# EasyEDA Pro project C8T6v1.eprj, board PCB4
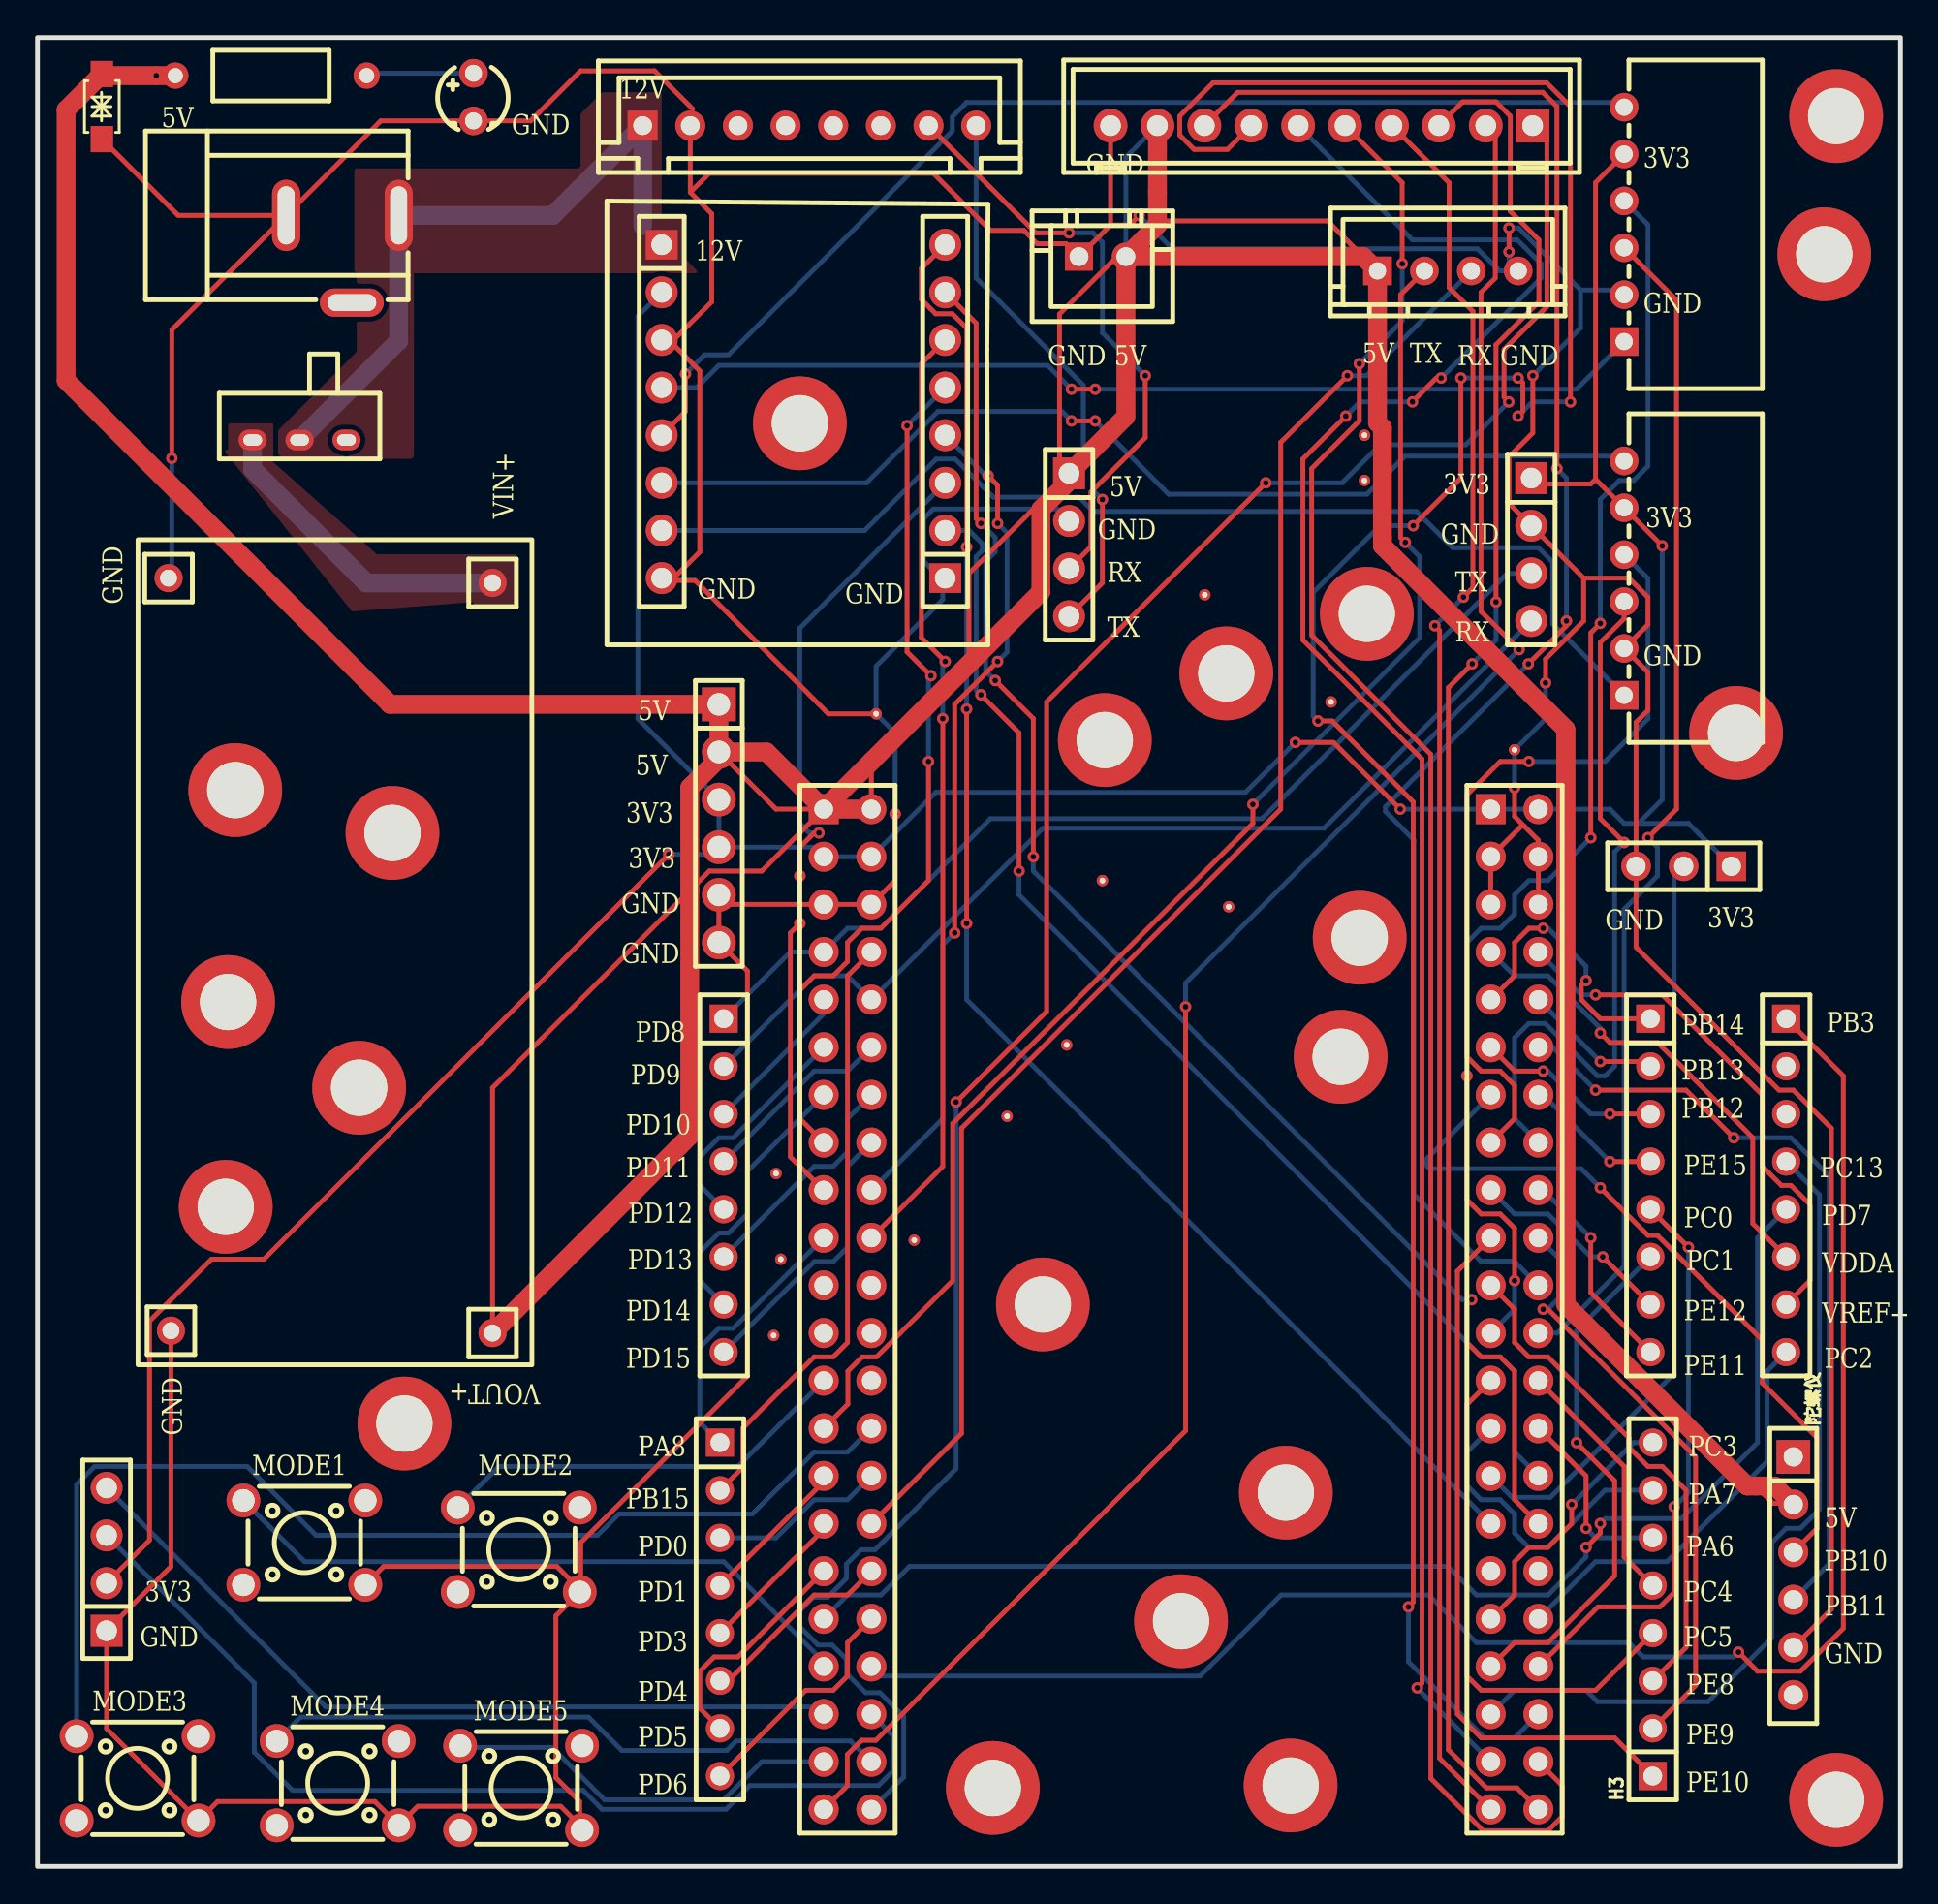
[diagram p8: board, top side]
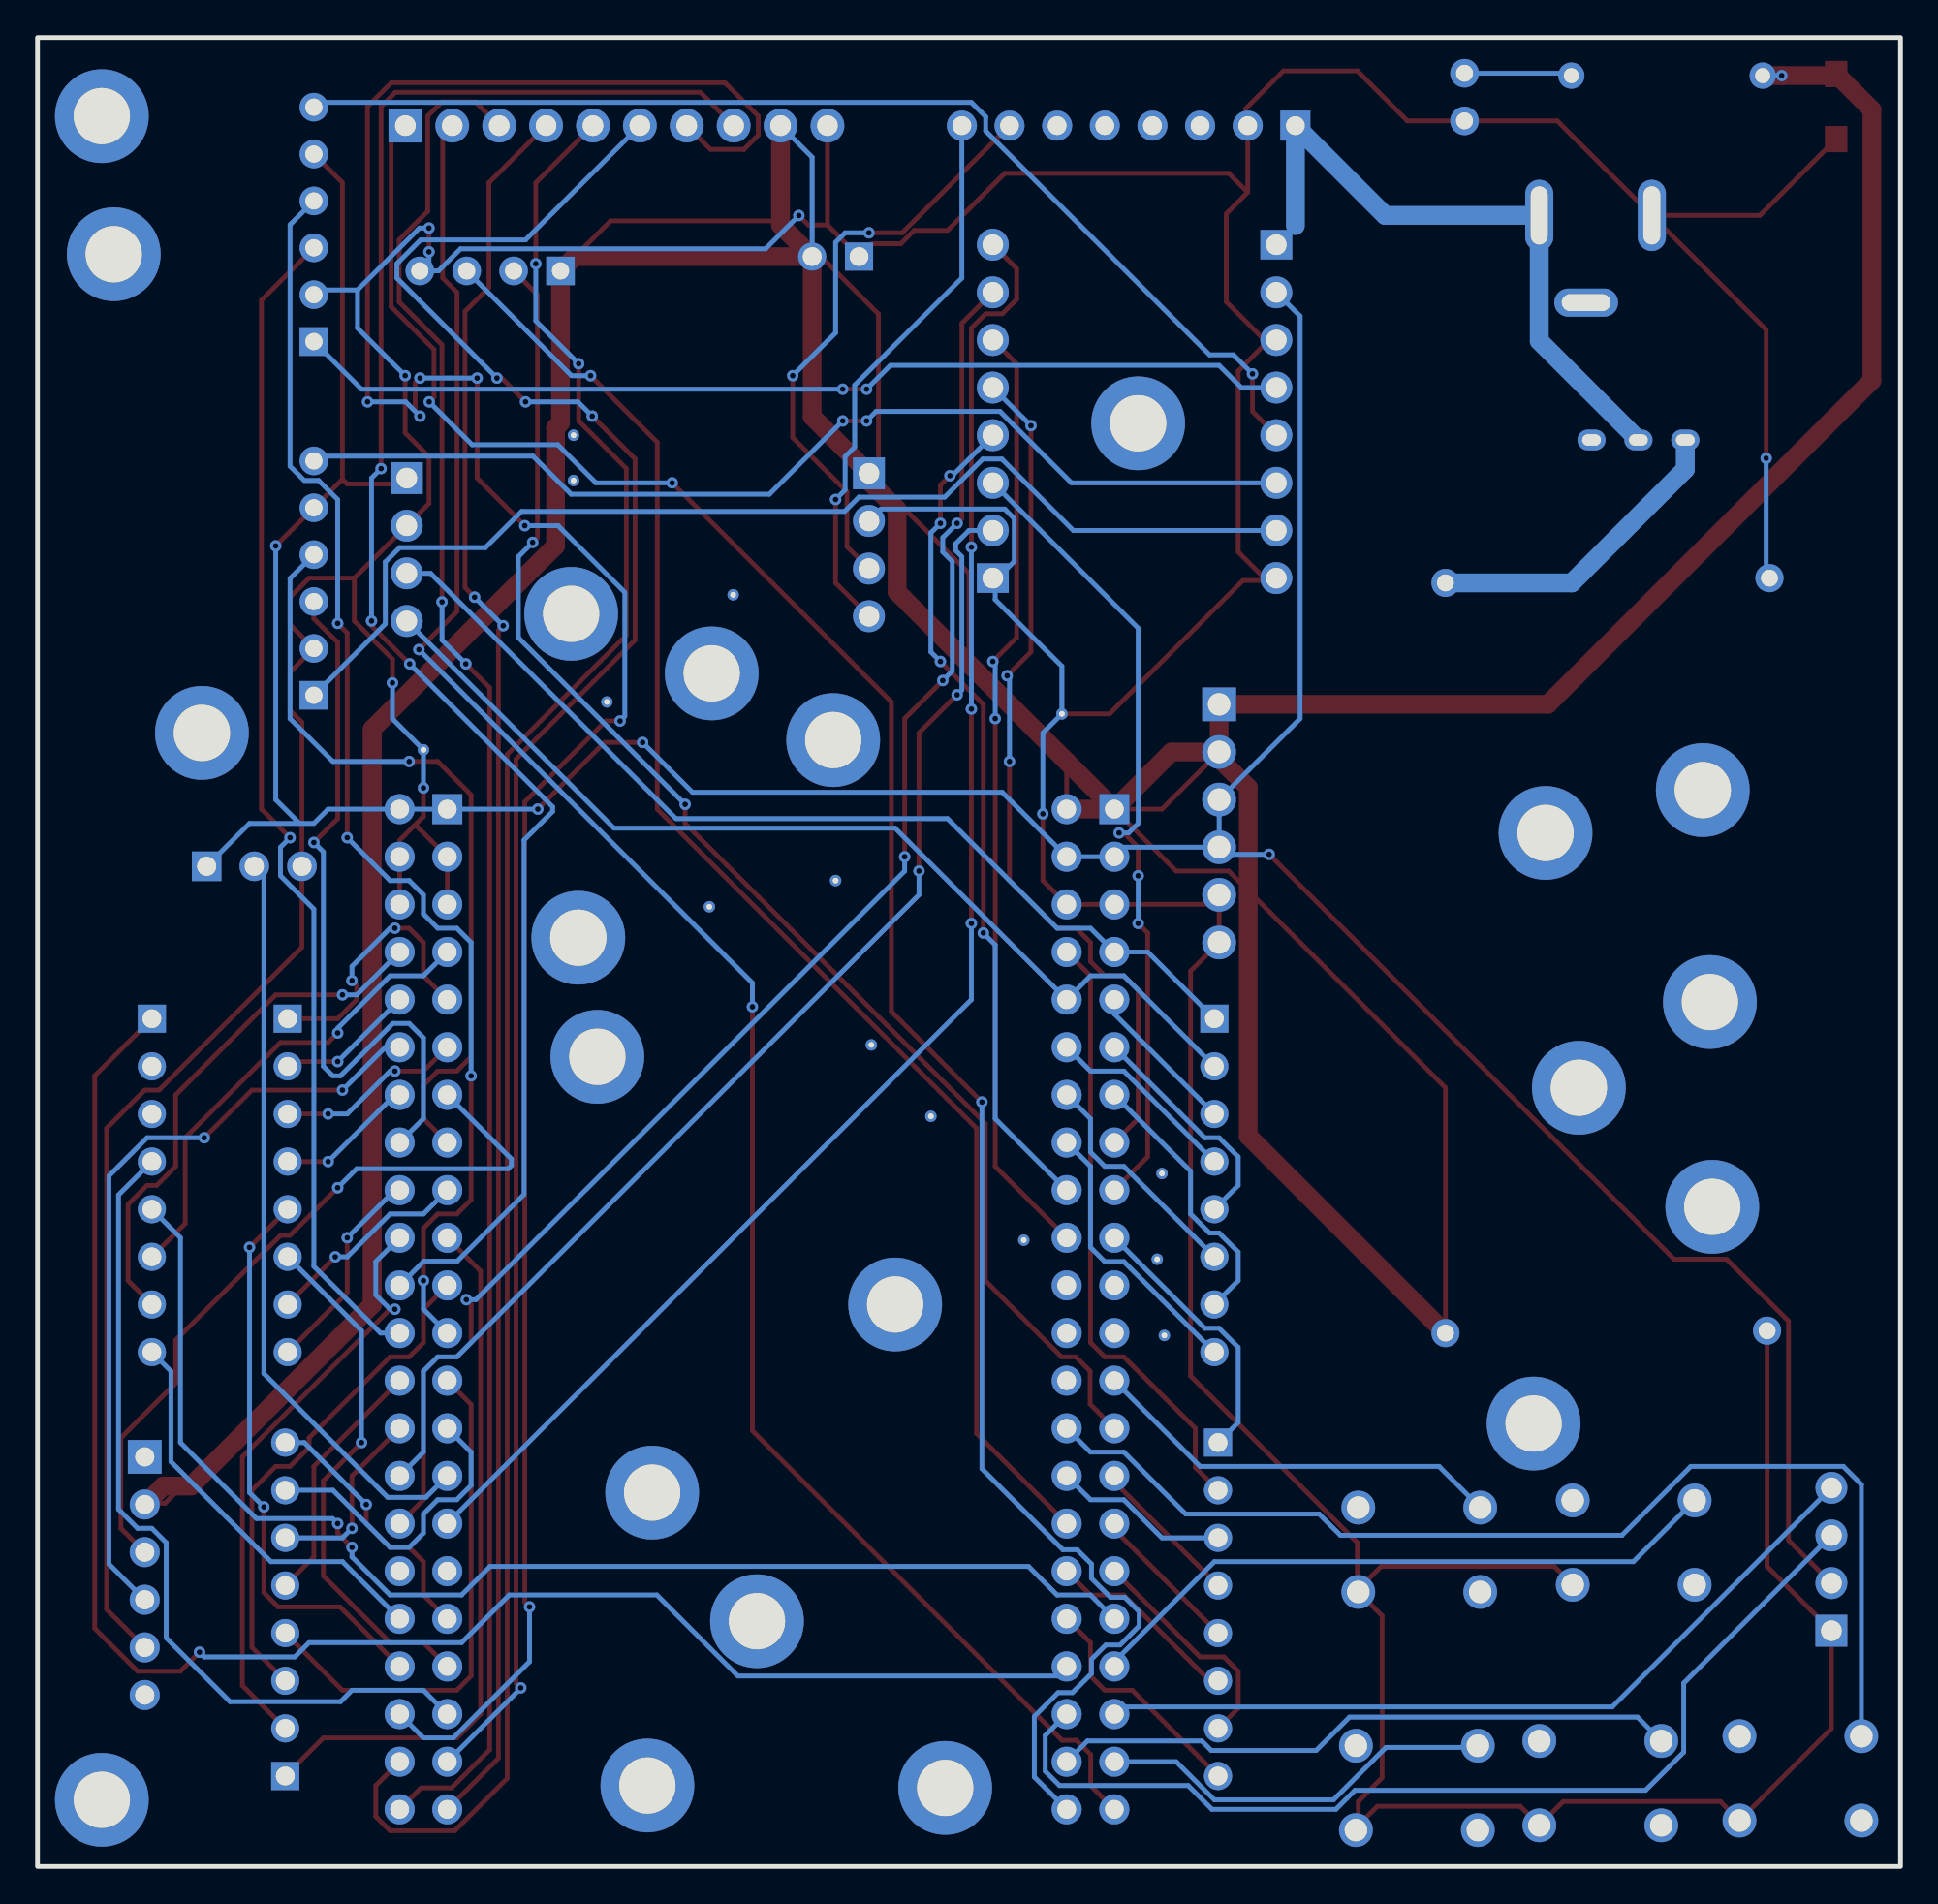
[diagram p9: board, bottom side, seen from below]

Outline 99.31 x 97.54 mm; copper layers: Top Layer, Bottom Layer. Coordinates in mm from the lower left corner of the outline.
Outline path: rectangle 0,97.54 99.31,0
Stack: Top Layer 0.035mm / Dielectric1 1.51mm FR4 er 4.5 / Bottom Layer 0.035mm

## Design rules (mm)
template: 自定义配置
spacing copperThickness1oz (default): track to track 0.102, other pairs 0.152 to 0.3
spacing copperThickness2oz: track to track 0.203, other pairs 0.152 to 0.3
track width copperThickness1oz (default): min 0.127, default 0.254, max 2.54
track width copperThickness2oz: min 0.203, default 0.254, max 2.54
differential pair differentialPair (default): width min 0.127, default 0.254, max 2.54; gap min 0.152, default 0.152
via viaSize (default): diameter min 0.5, default 0.61, max 10; hole min 0.3, default 0.305, max 6.3

## Placement (name value [footprint] x y rotation side)
CN2  HX-XH2.54-2PZZ  [CONN-TH_2P-P2.50_HX-2.54MM-2P-ZZ-MS]  56.77 85.85 0 top
CN4  A254F2L1-2W8P11  [CONN-TH_8P-P2.54_A254F2L1-2W8P11]  41.15 92.84 0 top
D1  SMF6.0CA  [SOD-123FL_L2.7-W1.8-LS3.8-BI]  3.43 93.85 270 top
DC1  DC-005-A200  [DC-IN-TH_DC-005-A200]  16.26 85.72 0 top
H1  PM254V-11-04-H85  [HDR-TH_4P-P2.54-V-F]  3.68 16.38 90 top
H2  PM254V-11-03-H85  [HDR-TH_3P-P2.54-V-F]  87.76 53.34 180 top
H3  PZ254V-11-08P  [HDR-TH_8P-P2.54-V-M]  86.11 13.72 90 top
H4  PZ254V-11-08P  [HDR-TH_8P-P2.54-V-M]  85.98 36.32 270 top
H5  PZ254V-11-08P  [HDR-TH_8P-P2.54-V-M]  93.22 36.32 270 top
H7  PZ254V-11-08P  [HDR-TH_8P-P2.54-V-M]  36.58 36.32 270 top
H8  PZ254V-11-08P  [HDR-TH_8P-P2.54-V-M]  36.38 13.72 270 top
H9  2.54-1x6P直针  [HDR-TH_6P-P2.54-V-M-1]  36.32 55.63 270 top
H10  PZ254V-11-04P  [HDR-TH_4P-P2.54-V-M]  54.99 70.48 270 top
H12  PZ254V-11-04P  [HDR-TH_4P-P2.54-V-M]  79.63 70.23 270 top
K230  WAFER-XH254Z-4AM  [CONN-TH_WAFER-XH2.54-4PZZ-H62]  75.18 85.09 0 top
LED1  RAD0.3  [LED-TH_BD3.8-P2.54-RD]  23.24 94.36 90 top
NOREF  -  [Pad_e6789]  95.88 3.56 0 top
NOREF#2  -  [Pad_e6791]  66.55 19.94 0 top
NOREF#3  -  [Pad_e8003]  68.96 62.1 0 top
NOREF#4  -  [Pad_e6798]  95.25 85.98 0 top
NOREF#5  -  [Pad_e8001]  39.62 32.38 0 top
NOREF#6  -  [Pad_e6800]  10.03 35.18 0 top
NOREF#7  -  [Pad_e6801]  19.56 23.62 0 top
NOREF#8  -  [Pad_e7414]  56.77 52.58 0 top
NOREF#9  -  [Pad_e8000]  39.24 28.32 0 top
NOREF#10  -  [Pad_e6805]  40.64 76.96 0 top
NOREF#11  -  [Pad_e8005]  70.74 76.33 0 top
NOREF#12  -  [Pad_e8586]  78.74 59.55 0 top
NOREF#13  -  [Pad_e6790]  60.96 13.08 0 top
NOREF#14  -  [Pad_e6788]  50.93 4.19 0 top
NOREF#15  -  [Pad_e6785]  17.14 41.53 0 top
NOREF#16  -  [Pad_e6792]  53.59 29.97 0 top
NOREF#17  -  [Pad_e6797]  95.88 93.34 0 top
NOREF#18  -  [Pad_e6781]  69.47 43.18 0 top
NOREF#19  -  [Pad_e7418]  51.69 40 0 top
NOREF#20  -  [Pad_e8002]  62.23 67.82 0 top
NOREF#21  -  [Pad_e7417]  54.86 43.81 0 top
NOREF#22  -  [Pad_e6786]  18.92 55.12 0 top
NOREF#23  -  [Pad_e6793]  70.87 66.8 0 top
NOREF#24  -  [Pad_e8006]  44.7 61.47 0 top
NOREF#25  -  [Pad_e7999]  39.37 36.96 0 top
NOREF#26  -  [Pad_e6784]  10.16 46.1 0 top
NOREF#27  -  [Pad_e8004]  70.74 73.91 0 top
NOREF#28  -  [Pad_e6794]  63.37 63.63 0 top
NOREF#29  -  [Pad_e6796]  56.9 60.07 0 top
NOREF#30  -  [Pad_e6804]  66.8 4.32 0 top
NOREF#31  -  [Pad_e6802]  90.55 60.45 0 top
NOREF#32  -  [Pad_e7998]  46.74 33.4 0 top
NOREF#33  -  [Pad_e6803]  70.48 49.53 0 top
NOREF#34  -  [Pad_e7416]  63.5 51.18 0 top
NOREF#35  -  [Pad_e6783]  10.54 57.4 0 top
R2  1kΩ  [RES-TH_BD2.7-L6.2-P10.20-D0.4]  12.45 95.5 180 top
SW1  MK-12D18-G020  [SW-TH_MK-12D18-G040]  13.97 76.07 180 top
SW2  TS665CJ  [SW-TH_4P-L6.0-W6.0-P4.50-LS6.5]  14.22 17.27 0 top
SW3  TS665CJ  [SW-TH_4P-L6.0-W6.0-P4.50-LS6.5]  25.65 16.89 0 top
SW4  TS665CJ  [SW-TH_4P-L6.0-W6.0-P4.50-LS6.5]  5.33 4.7 0 top
SW5  TS665CJ  [SW-TH_4P-L6.0-W6.0-P4.50-LS6.5]  16 4.44 0 top
SW6  TS665CJ  [SW-TH_4P-L6.0-W6.0-P4.50-LS6.5]  25.78 4.19 0 top
U1  HC-PM254-8.5H-2x22PZ  [HDR-TH_44P-P2.54-V-F-R2-C22-S2.54]  43.18 29.72 270 top
U2  HC-PM254-8.5H-2x22PZ  [HDR-TH_44P-P2.54-V-F-R2-C22-S2.54]  78.74 29.72 270 top
U5  WAFER-XH254WZ-6A  [CONN-TH_6P-P2.50_WAFER-XH254WZ-6A]  84.58 87.57 90 top
U6  WAFER-XH254WZ-6A  [CONN-TH_6P-P2.50_WAFER-XH254WZ-6A]  84.58 68.71 90 top
U7  PM254-1-08-Z-8.5  [HDR-TH_8P-P2.54-V-F]  33.27 77.6 270 top
U8  PM254-1-08-Z-8.5  [HDR-TH_8P-P2.54-V-F]  48.39 77.6 90 top
U19  MTBD1-D011000  [CONN-TH_MTBD1-D011000]  24.26 68.45 180 top
U20  MTBD1-D011000  [CONN-TH_MTBD1-D011000]  6.98 68.71 180 top
U21  MTBD1-D011000  [CONN-TH_MTBD1-D011000]  7.11 28.57 180 top
U22  MTBD1-D011000  [CONN-TH_MTBD1-D011000]  24.26 28.45 180 top
循迹  ZX-XH2.54-10PZZ  [CONN-TH_10P-P2.50_B10B-XH-A-LF-SN]  68.45 92.84 180 top
陀螺仪  2.54-1*6P母  [HDR-TH_6P-P2.54-V-F]  93.6 15.49 270 top

## Footprints (pads in the part's own frame, mm; a bottom-side part is the same pattern mirrored in y, then rotated)
CONN-TH_2P-P2.50_HX-2.54MM-2P-ZZ-MS
  rect 1.5x1.5 hole 1: 1(-1.25,0)
  round 1.5 hole 1: 2(1.25,0)
CONN-TH_6P-P2.50_WAFER-XH254WZ-6A
  rect 1.524x1.524 hole 0.914: 1(-6.25,0)
  round 1.524 hole 0.914: 2(-3.75,0) 3(-1.25,0) 4(1.25,0) 5(3.75,0) 6(6.25,0)
CONN-TH_8P-P2.54_A254F2L1-2W8P11
  rect 1.6x1.6 hole 1: 1(-8.89,0)
  round 1.6 hole 1: 2(-6.35,0) 3(-3.81,0) 4(-1.27,0) 5(1.27,0) 6(3.81,0) 7(6.35,0) 8(8.89,0)
CONN-TH_10P-P2.50_B10B-XH-A-LF-SN
  rect 1.8x1.8 hole 1.1: 1(-11.25,-0.001)
  round 1.8 hole 1.1: 2(-8.752,0.001) 3(-6.25,-0.001) 4(-3.75,-0.001) 5(-1.25,-0.001) 6(1.25,-0.001) 7(3.75,-0.001) 8(6.25,0.001) 9(8.75,0) 10(11.25,0)
CONN-TH_MTBD1-D011000
  round 1.5 hole 0.9: 1(0,0)
CONN-TH_WAFER-XH2.54-4PZZ-H62
  rect 1.524x1.524 hole 0.914: 1(-3.75,0)
  round 1.524 hole 0.914: 2(-1.25,0) 3(1.25,0) 4(3.75,0)
DC-IN-TH_DC-005-A200
  oval 1.5x3.8 hole 0.9x3.1: 1(3,2.325) 2(-3,2.325)
  oval 3.4x1.5 hole 2.6x0.9: 3(0.5,-2.325)
HDR-TH_3P-P2.54-V-F
  rect 1.575x1.575 hole 1.02: 1(-2.54,0)
  round 1.575 hole 1.02: 2(0,0) 3(2.54,0)
HDR-TH_4P-P2.54-V-F
  rect 1.7x1.7 hole 1.1: 1(-3.81,0)
  round 1.7 hole 1.1: 2(-1.27,0) 3(1.27,0) 4(3.81,0)
HDR-TH_4P-P2.54-V-M
  rect 1.7x1.7 hole 1.1: 1(-3.81,0)
  round 1.7 hole 1.1: 2(-1.27,0) 3(1.27,0) 4(3.81,0)
HDR-TH_6P-P2.54-V-F
  rect 1.8x1.8 hole 1.02: 1(-6.35,0)
  round 1.6 hole 1.02: 2(-3.81,0) 3(-1.27,0) 4(1.27,0) 5(3.81,0) 6(6.35,0)
HDR-TH_6P-P2.54-V-M-1
  rect 1.8x1.8 hole 1.2: 1(-6.35,0)
  round 1.8 hole 1.2: 2(-3.81,0) 3(-1.27,0) 4(1.27,0) 5(3.81,0) 6(6.35,0)
HDR-TH_8P-P2.54-V-F
  rect 1.575x1.7 hole 1.1: 1(-8.89,0)
  round 1.7 hole 1.1: 2(-6.35,0) 3(-3.81,0) 4(-1.27,0) 5(1.27,0) 6(3.81,0) 7(6.35,0) 8(8.89,0)
HDR-TH_8P-P2.54-V-M
  rect 1.5x1.5 hole 1: 1(-8.89,0)
  round 1.5 hole 1: 2(-6.35,0) 3(-3.81,0) 4(-1.27,0) 5(1.27,0) 6(3.81,0) 7(6.35,0) 8(8.89,0)
HDR-TH_44P-P2.54-V-F-R2-C22-S2.54
  rect 1.6x1.6 hole 1: 1(-26.67,-1.27)
  round 1.6 hole 1: 2(-26.67,1.27) 3(-24.13,-1.27) 4(-24.13,1.27) 5(-21.59,-1.27) 6(-21.59,1.27) 7(-19.05,-1.27) 8(-19.05,1.27) 9(-16.51,-1.27) 10(-16.51,1.27) 11(-13.97,-1.27) 12(-13.97,1.27) 13(-11.43,-1.27) 14(-11.43,1.27) 15(-8.89,-1.27) 16(-8.89,1.27) 17(-6.35,-1.27) 18(-6.35,1.27) 19(-3.81,-1.27) 20(-3.81,1.27) 21(-1.27,-1.27) 22(-1.27,1.27) 23(1.27,-1.27) 24(1.27,1.27) 25(3.81,-1.27) 26(3.81,1.27) 27(6.35,-1.27) 28(6.35,1.27) 29(8.89,-1.27) 30(8.89,1.27) 31(11.43,-1.27) 32(11.43,1.27) 33(13.97,-1.27) 34(13.97,1.27) 35(16.51,-1.27) 36(16.51,1.27) 37(19.05,-1.27) 38(19.05,1.27) 39(21.59,-1.27) 40(21.59,1.27) 41(24.13,-1.27) 42(24.13,1.27) 43(26.67,-1.27) 44(26.67,1.27)
LED-TH_BD3.8-P2.54-RD
  round 1.524 hole 0.9: 1(-1.27,0) 2(1.27,0)
Pad_e6781
  round 5 hole 3: 1(0,0)
Pad_e6783
  round 5 hole 3: 1(0,0)
Pad_e6784
  round 5 hole 3: 1(0,0)
Pad_e6785
  round 5 hole 3: 1(0,0)
Pad_e6786
  round 5 hole 3: 1(0,0)
Pad_e6788
  round 5 hole 3: 1(0,0)
Pad_e6789
  round 5 hole 3: 1(0,0)
Pad_e6790
  round 5 hole 3: 1(0,0)
Pad_e6791
  round 5 hole 3: 1(0,0)
Pad_e6792
  round 5 hole 3: 1(0,0)
Pad_e6793
  round 5 hole 3: 1(0,0)
Pad_e6794
  round 5 hole 3: 1(0,0)
Pad_e6796
  round 5 hole 3: 1(0,0)
Pad_e6797
  round 5 hole 3: 1(0,0)
Pad_e6798
  round 5 hole 3: 1(0,0)
Pad_e6800
  round 5 hole 3: 1(0,0)
Pad_e6801
  round 5 hole 3: 1(0,0)
Pad_e6802
  round 5 hole 3: 1(0,0)
Pad_e6803
  round 5 hole 3: 1(0,0)
Pad_e6804
  round 5 hole 3: 1(0,0)
Pad_e6805
  round 5 hole 3: 1(0,0)
Pad_e7414
  round 0.61 hole 0.305: 1(0,0)
Pad_e7416
  round 0.61 hole 0.305: 1(0,0)
Pad_e7417
  round 0.61 hole 0.305: 1(0,0)
Pad_e7418
  round 0.61 hole 0.305: 1(0,0)
Pad_e7998
  round 0.61 hole 0.305: 1(0,0)
Pad_e7999
  round 0.61 hole 0.305: 1(0,0)
Pad_e8000
  round 0.61 hole 0.305: 1(0,0)
Pad_e8001
  round 0.61 hole 0.305: 1(0,0)
Pad_e8002
  round 0.61 hole 0.305: 1(0,0)
Pad_e8003
  round 0.61 hole 0.305: 1(0,0)
Pad_e8004
  round 0.61 hole 0.305: 1(0,0)
Pad_e8005
  round 0.61 hole 0.305: 1(0,0)
Pad_e8006
  round 0.61 hole 0.305: 1(0,0)
Pad_e8586
  round 0.61 hole 0.305: 1(0,0)
RES-TH_BD2.7-L6.2-P10.20-D0.4
  round 1.4 hole 0.8: 1(-5.1,0) 2(5.1,0)
SOD-123FL_L2.7-W1.8-LS3.8-BI
  rect 1.4x1.2 smd: 1(-1.735,0) 2(1.735,0)
SW-TH_4P-L6.0-W6.0-P4.50-LS6.5
  round 1.8 hole 1.2: 1(-3.25,2.25) 2(3.25,2.25) 3(-3.25,-2.25) 4(3.25,-2.25)
SW-TH_MK-12D18-G040
  oval 1.5x1.1 hole 1x0.6: 1(-2.5,0) 2(0,0) 3(2.5,0)

## Nets
3V3: H1.2 H2.1 H9.3 H9.4 H12.1 U1.3 U1.4 U2.1 U2.2 U5.5 U6.5 U7.2
5V: CN2.2 D1.1 H9.1 H9.2 H10.1 K230.1 R2.2 U1.1 U1.2 U22.1 循迹.9 陀螺仪.2
12V: CN4.1 DC1.1 SW1.2 U7.1
GND: CN2.1 CN4.2 D1.2 DC1.2 H1.1 H2.3 H9.5 H9.6 H10.2 H12.2 K230.4 LED1.1 NOREF#12.1 NOREF#24.1 SW2.4 SW3.4 SW4.4 SW5.4 SW6.4 U1.5 U1.6 U2.3 U2.4 U2.5 U2.6 U5.2 U6.2 U7.3 U7.8 U8.1 U20.1 U21.1 循迹.10 陀螺仪.5
VDDA: H5.6 U2.7
AIN1: U1.20 U8.6
AIN2: U2.32 U8.7
AO1: U5.1 U7.4
AO2: U5.6 U7.5
BIN1: U1.18 U8.4
BIN2: U1.17 U8.3
BO1: U6.1 U7.7
BO2: U6.6 U7.6
ENCA_L: U2.23 U5.4
ENCA_R: U2.15 U6.4
ENCB_L: U2.24 U5.3
ENCB_R: U2.16 U6.3
O_SCL: H1.3 U1.40
O_SDA: H1.4 U1.39
PA3: U2.31 U8.8
PA4: U2.30 U8.2
PA5: H2.2 U2.29
PA6: H3.6 U2.28
PA7: H3.7 U2.27
PA8: H8.1 U1.19
PB3: H5.1 U1.38
PB5: SW2.1 U1.37
PB8: SW5.1 U1.42
PB9: SW6.1 U1.41
PB10: U2.13 陀螺仪.3
PB11: U2.12 陀螺仪.4
PB12: H4.3 U2.11
PB13: H4.2 U2.10
PB14: H4.1 U2.9
PB15: H8.2 U1.8
PC0: H4.5 U2.38
PC1: H4.6 U2.37
PC2: H5.8 U2.36
PC3: H3.8 U2.35
PC4: H3.5 U2.26
PC5: H3.4 U2.25
PC6: U1.15 U8.5
PC10: SW3.1 U1.25
PC11: SW4.1 U1.28
PC12: K230.2 U1.27
PC13: H5.4 U2.39
PD0: H8.3 U1.30
PD1: H8.4 U1.29
PD2: K230.3 U1.32
PD3: H8.5 U1.31
PD4: H8.6 U1.34
PD5: H8.7 U1.33
PD6: H8.8 U1.36
PD7: H5.5 U1.35
PD8: H7.1 H12.3 U1.7
PD9: H7.2 H12.4 U1.10
PD10: H7.3 U1.9
PD11: H7.4 U1.12
PD12: H7.5 U1.11
PD13: H7.6 U1.14
PD14: H7.7 U1.13
PD15: H7.8 U1.16
PE0: U1.44 循迹.1
PE1: U1.43 循迹.2
PE2: U2.44 循迹.3
PE3: U2.43 循迹.4
PE4: U2.42 循迹.5
PE5: U2.41 循迹.6
PE6: U2.40 循迹.7
PE7: U2.22 循迹.8
PE8: H3.3 U2.21
PE9: H3.2 U2.20
PE10: H3.1 U2.19
PE11: H4.8 U2.18
PE12: H4.7 U2.17
PE15: H4.4 U2.14
POWER: SW1.3 U19.1
R/A/H: CN4.7 H10.3
T/B/L: CN4.8 H10.4
VREF+: H5.7 U2.8
$1N1923: LED1.2 R2.1

Pads without a net: CN4 3 4 5 6; DC1 3; H5 2 3; NOREF 1; NOREF#2 1; NOREF#3 1; NOREF#4 1; NOREF#5 1; NOREF#6 1; NOREF#7 1; NOREF#8 1; NOREF#9 1; NOREF#10 1; NOREF#11 1; NOREF#13 1; NOREF#14 1; NOREF#15 1; NOREF#16 1; NOREF#17 1; NOREF#18 1; NOREF#19 1; NOREF#20 1; NOREF#21 1; NOREF#22 1; NOREF#23 1; NOREF#25 1; NOREF#26 1; NOREF#27 1; NOREF#28 1; NOREF#29 1; NOREF#30 1; NOREF#31 1; NOREF#32 1; NOREF#33 1; NOREF#34 1; NOREF#35 1; SW1 1; SW2 2 3; SW3 2 3; SW4 2 3; SW5 2 3; SW6 2 3; U1 21 22 23 24 26; U2 33 34; 陀螺仪 1 6

## Via types
v1: diameter 0.61, hole 0.305, Top Layer to Bottom Layer, 99 vias

## Routing (per net, layer and track width the routed paths; a pad name or vN(x,y) marks a point on that pad's centre or on a via; arc(x,y) is an arc through that point)
3V3: length 189.1
  Top Layer w0.254: 83.06,73.98 83.06,89.8 U5.5 ; 83.06,73.98 82.8,73.73 79.94,73.73 H12.1 ; 83.06,73.98 U6.5 v1(86.61,70.42) ; H1.2 5.97,17.4 5.97,29.08 9.27,32.38 12.06,32.38 v1(33.66,53.97) ; v1(67.06,59.94) 69.09,59.94 v1(72.64,56.39)
  Bottom Layer w0.254: v1(33.66,53.97) 35.94,53.97 H9.4 ; H9.4 41.4,54.36 U1.3 U1.4 47.89,57.29 64.4,57.29 v1(67.06,59.94) ; H9.4 H9.3 32,61.21 32,82.68 U7.2 ; v1(72.64,56.39) U2.1 U2.2 83.82,56.39 84.58,55.63 85.34,55.63 ; H2.1 88.01,55.63 85.34,55.63 ; 85.34,55.63 86.61,56.9 v1(86.61,70.42)
5V: length 373.1
  Top Layer w0.254: H9.2 39.37,56.39 U1.1 38.61,53.09 35.81,53.09 24.26,41.53 U22.1 ; 70.67,85.85 68.77,87.76 59.45,87.76 54.48,82.79 54.48,74.8 H10.1 49.66,68.96 49.66,64.64 ; 59.7,89.28 59.45,89.03 ; 81.85,60.71 81.85,30.04 ; 93.53,19.37 92.52,19.37 91.59,20.29 ; U1.2 44.45,59.44 ; 71.43,71.12 71.7,70.86
  Top Layer w1: H9.2 36.32,59.09 34.77,57.54 34.77,38.96 U22.1 ; H9.2 38.86,59.44 U1.1 ; H9.2 H9.1 18.8,61.98 1.52,79.25 1.52,93.68 D1.1 3.51,95.5 v1(6.33,95.5) R2.2 ; U1.1 U1.2 ; U1.1 53.49,67.97 53.49,72.38 54.99,73.88 H10.1 58.02,77.32 CN2.2 ; CN2.2 59.7,87.54 循迹.9 ; CN2.2 70.67,85.85 K230.1 71.43,76.99 71.7,76.72 71.7,70.43 81.46,60.66 81.46,29.97 91.14,20.29 92.61,20.29 陀螺仪.2
  Bottom Layer w0.254: CN2.2 58.02,91.15 循迹.9 ; R2.2 v1(6.33,95.5)
12V: length 35.9
  Bottom Layer w0.254: 32.26,87.5 U7.1
  Bottom Layer w1: 32.26,87.5 CN4.1 27.47,88.05 DC1.1 19.26,81.36 SW1.2
GND: length 433.9
  Top Layer w0.254: v1(58.73,88.04) 58.22,87.54 57.2,87.54 ; 28.7,14.99 28.96,15.24 28.96,17.27 37.85,26.16 37.85,47.75 H9.6 H9.5 36.83,51.31 U1.5 U1.6 45.72,52.58 v1(45.72,56.13) ; 28.7,14.99 27.69,16 18.45,16 SW2.4 ; 28.7,14.99 28.7,14.84 SW3.4 27.63,13.37 27.63,4.73 28.9,3.47 28.9,2.19 ; 34.8,89.28 35.94,88.14 35.94,83.44 33.78,81.28 ; 34.8,89.28 CN4.2 ; 34.8,89.28 35.81,90.3 47.75,90.3 50.8,87.25 52.58,87.25 53.29,86.54 54.83,86.54 CN2.1 57.2,87.54 ; 33.78,81.28 33.4,81.28 U7.3 ; 33.78,81.28 35.31,79.76 35.31,70.1 33.78,68.58 ; DC1.2 7.5,88.05 D1.2 ; DC1.2 7.16,81.95 v1(7.16,75.1) ; DC1.2 18.3,93.09 LED1.1 26.29,93.09 28.96,95.76 32.89,95.76 34.92,93.73 ; 82.42,68.71 84.84,68.71 85.85,67.69 85.85,66.23 U6.2 85.85,63.69 85.85,61.65 85.22,61.02 H2.3 85.22,49.02 92.84,41.4 93.6,41.4 95.63,39.37 95.63,13.72 陀螺仪.5 ; 82.42,68.71 82.42,66.42 80.39,64.39 v1(80.39,63.12) ; 82.42,68.71 H12.2 78.44,72.68 78.44,75.18 79.72,76.45 v1(79.72,79.5) ; 33.78,68.58 33.4,68.58 U7.8 ; 33.78,68.58 35.05,68.58 42.16,61.47 NOREF#24.1 ; 28.9,2.19 27.89,3.21 20.27,3.21 SW5.4 17.98,3.47 9.6,3.47 SW4.4 3.68,7.35 H1.1 7.11,16 U21.1 ; 28.9,2.19 28.9,2.07 SW6.4 ; U2.5 U2.3 79.11,55.49 79.25,55.49 ; 79.25,55.49 78.74,55.99 v1(78.74,57.52) ; 79.25,55.49 80.01,54.72 U2.4 U2.6 ; 57.2,87.54 循迹.10 ; v1(78.44,86.11) v1(78.44,87.38)
  Bottom Layer w0.254: v1(79.72,79.5) 82.25,82.04 82.25,84.07 ; 82.25,84.07 78.95,87.38 v1(78.44,87.38) ; 82.25,84.07 84.33,84.07 U5.2 ; 48.26,68.58 U8.1 ; 48.26,68.58 47.24,69.6 47.24,71.88 47.75,72.39 54.36,72.39 H10.2 ; 48.26,68.58 48.26,67.56 44.7,64.01 NOREF#24.1 45.72,60.45 v1(45.72,56.13) ; v1(80.39,63.12) 80.39,61.2 NOREF#12.1 v1(78.74,57.52) ; U20.1 7.16,68.88 v1(7.16,75.1) ; 78.44,85.09 v1(78.44,86.11) ; 78.44,85.09 77.94,85.09 76.76,86.27 60.5,86.27 v1(58.73,88.04) ; 78.44,85.09 K230.4
VDDA: length 25.3
  Top Layer w0.254: v1(83.31,44.45) 83.82,43.94 86.36,43.94 91.44,38.86 91.44,34.29 H5.6
  Bottom Layer w0.254: v1(83.31,44.45) 83.31,44.7 80.52,47.5 78.74,47.5 U2.7
AIN1: length 50.6
  Top Layer w0.254: v1(48.26,61.21) 48.26,37.34 U1.20 ; v1(48.39,64.26) 47.12,65.53 47.12,80.14 U8.6
  Bottom Layer w0.254: v1(48.26,61.21) 48.26,64.13 v1(48.39,64.26)
AIN2: length 80.3
  Top Layer w0.254: v1(51.05,63.25) 53.09,61.21 v1(53.09,53.85) ; U2.32 78.74,19.56 78.74,26.42 77.98,27.18 76.96,27.18 76.2,27.94 76.2,29.97 v1(76.45,30.23) ; U8.7 50.04,82.3 50.04,71.88 v1(50.29,71.63)
  Bottom Layer w0.254: v1(51.05,63.25) 50.55,63.75 50.55,69.6 51.05,70.1 51.05,70.87 v1(50.29,71.63) ; v1(76.45,30.23) 75.95,30.23 53.09,53.09 v1(53.09,53.85)
AO1: length 53.4
  Top Layer w0.254: v1(56.39,78.78) v1(55.12,78.78)
  Bottom Layer w0.254: U7.4 35.14,78.87 36.32,80.05 53.85,80.05 v1(55.12,78.78) ; v1(56.39,78.78) 82.04,78.78 U5.1
AO2: length 60.4
  Top Layer w0.254: U7.5 34.54,77.6 v1(34.54,79.6)
  Bottom Layer w0.254: U5.6 84.33,94.08 49.53,94.08 48.77,93.31 48.77,92.55 36.83,80.61 35.56,80.61 v1(34.54,79.6)
BIN1: length 44.7
  Top Layer w0.254: v1(51.18,71.63) 51.18,73.66 v1(50.67,74.17) ; v1(51.18,64.26) 48.89,61.98 v1(48.89,49.78)
  Bottom Layer w0.254: v1(50.67,74.17) 50.55,74.17 U8.4 ; v1(48.89,49.78) 48.26,49.15 48.26,39.88 U1.18 ; v1(51.18,71.63) 51.69,71.12 51.69,64.77 v1(51.18,64.26)
BIN2: length 43.2
  Top Layer w0.254: v1(40.64,52.83) 40.64,54.36 41.4,55.12 v1(41.66,55.12) ; U1.17 40.13,37.85 40.13,49.78 v1(40.64,50.29)
  Bottom Layer w0.254: v1(41.66,55.12) 41.15,55.12 40.64,55.63 40.64,66.04 U8.3 ; v1(40.64,50.29) v1(40.64,52.83)
BO1: length 60
  Bottom Layer w0.254: U6.1 80.77,66.27 80.77,69.57 80.01,70.33 75.44,70.33 73.51,72.26 56.29,72.26 55.53,73.02 50.95,73.02 48.92,75.06 47.91,75.06 44.1,71.25 U7.7
BO2: length 55.7
  Top Layer w0.254: v1(56.39,77.09) v1(55.12,77.09)
  Bottom Layer w0.254: U7.6 44.2,73.79 48.01,77.6 54.61,77.6 v1(55.12,77.09) ; v1(56.39,77.09) 60.3,73.18 70.87,73.18 72.9,75.21 84.33,75.21 U6.6
ENCA_L: length 68.7
  Top Layer w0.254: v1(76.2,42.16) 76.2,35.56 76.96,34.8 77.98,34.8 78.74,34.04 v1(78.74,31.24) ; v1(82.8,54.86) 82.8,65.79 v1(83.31,66.29)
  Bottom Layer w0.254: v1(82.8,54.86) 80.52,52.58 79.5,52.58 78.74,51.82 78.74,50.8 77.98,50.04 76.96,50.04 76.2,49.28 v1(76.2,42.16) ; U2.23 78.74,29.72 v1(78.74,31.24) ; U5.4 85.85,87.55 85.85,74.68 85.09,73.91 84.33,73.91 83.31,72.9 v1(83.31,66.29)
ENCA_R: length 41.3
  Top Layer w0.254: v1(79.5,58.93) 77.98,58.93 76.2,57.15 76.2,43.18 76.96,42.42 77.98,42.42 78.74,41.66 78.74,39.88 U2.15
  Bottom Layer w0.254: v1(79.5,58.93) 83.57,58.93 85.85,61.21 85.85,68.69 U6.4
ENCB_L: length 63.1
  Top Layer w0.254: U5.3 87.38,83.53 87.38,56.39 v1(85.85,54.86)
  Bottom Layer w0.254: v1(85.85,54.86) 86.36,54.36 86.36,52.83 84.58,51.05 84.58,32 81.03,28.45 U2.24
ENCB_R: length 39.2
  Top Layer w0.254: U6.3 84.58,66.55 83.31,65.28 83.31,55.88 v1(84.58,54.61)
  Bottom Layer w0.254: v1(84.58,54.61) 84.07,54.1 84.07,42.67 83.57,42.16 83.17,42.16 80.37,44.96 79.5,44.96 78.74,44.2 78.74,39.88 U2.16
O_SCL: length 54.5
  Bottom Layer w0.254: H1.3 11.56,9.78 11.56,6.1 13.59,4.06 29.08,4.06 30.1,3.05 36.7,3.05 37.97,4.32 44.83,4.32 45.59,5.08 45.59,6.98 U1.40
O_SDA: length 43.2
  Bottom Layer w0.254: U1.39 41.53,8.51 15.37,8.51 H1.4
PA3: length 81.8
  Top Layer w0.254: U8.8 47.12,85.22 47.12,83.57 47.88,82.8 48.77,82.8 49.53,82.04 v1(49.53,70.36) ; v1(49.53,50.29) v1(49.53,61.72)
  Bottom Layer w0.254: v1(49.53,61.72) v1(49.53,70.36) ; v1(49.53,50.29) 49.53,46.23 U2.31
PA4: length 65.1
  Top Layer w0.254: v1(50.29,62.48) 52.32,60.45 v1(52.32,53.09)
  Bottom Layer w0.254: v1(52.32,53.09) 52.32,51.82 76.96,27.18 77.98,27.18 78.74,26.42 78.74,22.1 U2.30 ; v1(50.29,62.48) 50.04,62.74 50.04,69.85 50.37,70.18 50.37,70.54 49.66,71.25 U8.2
PA5: length 40.2
  Bottom Layer w0.254: H2.2 87.25,52.83 87.25,26.29 80.64,19.69 78.61,19.69 U2.29
PA6: length 10.2
  Top Layer w0.254: v1(82.55,18.03) 82.55,20.83 U2.28
  Bottom Layer w0.254: H3.6 83.06,17.53 v1(82.55,18.03)
PA7: length 16.7
  Bottom Layer w0.254: U2.27 76.2,22.1 76.2,20.32 76.96,19.56 77.98,19.56 78.74,18.8 78.74,17.78 79.5,17.02 80.52,17.02 83.57,20.07 86.11,20.07
PA8: length 14.5
  Bottom Layer w0.254: U1.19 37.08,28.7 36.32,28.7 35.31,27.69 35.31,23.68 H8.1
PB3: length 90.4
  Top Layer w0.254: v1(90.68,11.43) 91.69,10.41 93.98,10.41 96.27,12.7 96.27,42.16 H5.1
  Bottom Layer w0.254: U1.38 44.96,10.16 61.98,10.16 66.29,14.48 74.17,14.48 76.71,11.94 84.84,11.94 85.6,11.18 90.42,11.18 v1(90.68,11.43)
PB5: length 34.8
  Bottom Layer w0.254: U1.37 41.91,10.92 36.58,16.26 14.24,16.26 SW2.1
PB8: length 33.6
  Bottom Layer w0.254: U1.42 43.34,6.69 37.25,6.69 36.74,6.19 31.15,6.19 29.37,7.97 14.02,7.97 SW5.1
PB9: length 21.4
  Bottom Layer w0.254: SW6.1 22.62,6.35 27.43,6.35 30.23,3.56 36.58,3.56 38.61,5.59 U1.41
PB10: length 40
  Top Layer w0.254: 93.6,16.76 94.87,18.03 94.87,22.86 91.95,25.78 91.95,28.07 86.36,33.65 85.85,33.65 v1(83.31,36.19)
  Bottom Layer w0.254: U2.13 74.05,37.73 74.05,37.38 74.22,37.21 82.3,37.21 v1(83.31,36.19)
PB11: length 41.7
  Top Layer w0.254: v1(90.42,38.86) 87.88,41.4 v1(83.06,41.4)
  Bottom Layer w0.254: v1(90.42,38.86) 93.47,38.86 95.5,36.83 95.5,16.13 陀螺仪.4 ; v1(83.06,41.4) 80.77,43.69 U2.12
PB12: length 10
  Top Layer w0.254: U2.11 78.74,42.42 v1(80.26,42.42) ; v1(83.82,40.13) H4.3
  Bottom Layer w0.254: v1(83.82,40.13) 82.8,40.13 80.52,42.42 v1(80.26,42.42)
PB13: length 7.4
  Top Layer w0.254: H4.2 85.72,42.93 v1(83.31,42.93)
  Bottom Layer w0.254: U2.10 v1(83.31,42.93)
PB14: length 14.5
  Top Layer w0.254: U2.9 78.74,47.5 78.74,49.28 79.5,50.04 v1(80.26,50.04) ; v1(82.55,47.24) 82.3,46.99 82.3,46.23 83.31,45.21 H4.1
  Bottom Layer w0.254: v1(80.26,50.04) 80.52,50.04 82.55,48.01 v1(82.55,47.24)
PB15: length 32.6
  Top Layer w0.254: 36.38,20.07 37.59,21.28 37.59,23.37 41.4,27.18 42.42,27.18 43.18,27.94 43.18,47.5 U1.8
PC0: length 30.5
  Top Layer w0.254: U2.38 83.19,13.84 86.49,13.84 87.25,14.6 v1(87.25,19.18) ; v1(88.01,33.02) H4.5
  Bottom Layer w0.254: v1(87.25,19.18) 88.01,19.94 v1(88.01,33.02)
PC1: length 28.1
  Top Layer w0.254: U2.37 78.74,11.94 80.52,11.94 84.07,15.49 84.07,20.57 v1(82.04,22.61)
  Bottom Layer w0.254: H4.6 82.04,28.57 v1(82.04,22.61)
PC2: length 21.9
  Bottom Layer w0.254: H5.8 92.2,26.42 92.2,21.59 86.87,16.26 83.06,16.26 U2.36
PC3: length 14.2
  Top Layer w0.254: U2.35 78.74,14.48 78.74,16.26 79.5,17.02 80.52,17.02 81.79,18.29 v1(81.79,19.3)
  Bottom Layer w0.254: H3.8 85.09,22.61 v1(81.79,19.3)
PC4: length 13.4
  Top Layer w0.254: U2.26 84.58,21.34 84.58,16.51 H3.5
PC5: length 27.8
  Top Layer w0.254: U2.25 76.2,24.64 76.2,10.16 76.96,9.4 83.06,9.4 86.11,12.45
PC6: length 46.2
  Top Layer w0.254: v1(47.5,58.93) 47.5,52.58 44.96,50.04 43.94,50.04 43.18,49.28 43.18,48.26 42.42,47.5 41.4,47.5 40.64,46.74 40.64,39.88 U1.15 ; v1(47.62,63.5) 46.35,64.77 v1(46.35,76.83)
  Bottom Layer w0.254: v1(47.62,63.5) 47.5,63.37 v1(47.5,58.93) ; v1(46.35,76.83) U8.5
PC10: length 22.3
  Bottom Layer w0.254: U1.25 37.34,21.34 24.6,21.34 SW3.1
PC11: length 60.1
  Bottom Layer w0.254: U1.28 43.18,22.1 41.4,22.1 38.1,18.8 30.99,18.8 29.85,17.66 14.85,17.66 11.18,21.34 3.05,21.34 2.08,20.37 SW4.1
PC12: length 76.3
  Top Layer w0.254: U1.27 43.2,24.66 43.2,26.42 43.96,27.18 44.72,27.18 48.79,31.24 48.79,39.62 64.79,55.63 v1(64.79,56.64) ; K230.2 72.66,83.82 72.66,70.87 v1(72.92,70.61)
  Bottom Layer w0.254: v1(64.79,56.64) 73.68,65.53 73.68,69.85 v1(72.92,70.61)
PC13: length 44.8
  Bottom Layer w0.254: U2.39 78.74,9.4 82.55,9.4 83.16,8.79 89.05,8.79 92.46,12.19 92.46,17.27 93.22,18.03 93.98,18.03 95,19.05 95,35.81 H5.4
PD0: length 9.4
  Bottom Layer w0.254: H8.3 39.37,17.53 41.4,19.56 43.18,19.56 U1.30
PD1: length 8.1
  Top Layer w0.254: H8.4 41.91,20.52 U1.29
PD2: length 80.6
  Top Layer w0.254: v1(69.83,79.5) 66.27,75.95 66.27,56.39 49.26,39.37 49.26,23.09 U1.32
  Bottom Layer w0.254: K230.3 70.85,79.5 v1(69.83,79.5)
PD3: length 8.1
  Top Layer w0.254: 36.38,12.45 41.91,17.98 U1.31
PD4: length 10.5
  Top Layer w0.254: U1.34 43.18,14.48 41.4,14.48 36.83,9.91 36.38,9.91
PD5: length 12.3
  Top Layer w0.254: H8.7 35.31,8.44 35.31,10.41 36.07,11.18 37.34,11.18 U1.33
PD6: length 12.6
  Top Layer w0.254: U1.36 43.18,11.94 43.18,10.16 42.42,9.4 40.95,9.4 36.38,4.83
PD7: length 68.6
  Top Layer w0.254: v1(83.31,18.29) 83.31,17.78 v1(82.55,17.02)
  Bottom Layer w0.254: H5.5 91.69,33.53 91.69,22.61 87.64,18.56 83.58,18.56 v1(83.31,18.29) ; U1.35 43.18,14.48 44.96,14.48 46.48,16 75.18,16 76.71,14.48 80.52,14.48 82.55,16.51 v1(82.55,17.02)
PD8: length 52.9
  Bottom Layer w0.254: H12.3 78.36,68.96 65.28,55.88 50.8,55.88 44.96,50.04 43.18,50.04 U1.7 40.13,48.77 H7.1
PD9: length 53.9
  Bottom Layer w0.254: H12.4 68.58,55.37 53.59,55.37 U1.10 43.18,47.5 41.4,47.5 H7.2
PD10: length 8.3
  Bottom Layer w0.254: U1.9 41.91,45.47 H7.3
PD11: length 10.4
  Bottom Layer w0.254: U1.12 43.18,42.42 41.4,42.42 H7.4
PD12: length 12.3
  Bottom Layer w0.254: U1.11 37.08,38.86 36.32,38.86 35.31,37.85 35.31,36.32 H7.5
PD13: length 12.5
  Bottom Layer w0.254: U1.14 43.18,39.88 43.18,38.1 42.42,37.34 41.4,37.34 H7.6
PD14: length 14.7
  Bottom Layer w0.254: U1.13 37.85,37.08 37.85,34.8 36.83,33.78 36.32,33.78 35.31,32.77 35.31,31.24 H7.7
PD15: length 15
  Bottom Layer w0.254: U1.16 43.18,37.34 43.18,33.02 42.42,32.26 41.4,32.26 H7.8
PE0: length 116.7
  Top Layer w0.254: v1(78.43,78.11) 78.18,78.36 78.18,80.9 80.47,83.19 80.47,92.08 79.7,92.84 ; v1(65.48,73.79) 53.79,62.1 53.79,45.59 v1(48.97,40.77)
  Bottom Layer w0.254: v1(78.43,78.11) 76.15,75.82 71.57,75.82 69.54,73.79 v1(65.48,73.79) ; U1.44 46.17,4.77 46.17,8 44.91,9.27 44.14,9.27 43.13,10.29 43.13,11.05 42.37,11.81 41.6,11.81 40.59,12.83 40.59,13.59 41.35,14.35 42.11,14.35 43.13,15.37 43.13,16.13 43.89,16.89 44.65,16.89 48.97,21.21 v1(48.97,40.77)
PE1: length 107
  Top Layer w0.254: v1(78.98,64.9) 76.95,66.93 76.95,83.95 77.71,84.71 77.71,92.33 循迹.2 ; U1.43 43.17,4.31 43.17,5.97 43.93,6.73 44.69,6.73 61.2,23.24 v1(61.2,45.85)
  Bottom Layer w0.254: v1(78.98,64.9) 61.2,47.12 v1(61.2,45.85)
PE2: length 100.5
  Top Layer w0.254: 74.7,92.84 75.97,94.11 77.75,94.11 78.51,93.35 78.51,88.27 80.04,86.74 80.04,83.44 77.75,81.15 v1(77.75,67.44) ; v1(76.48,64.14) 75.21,62.87 75.21,6.22 77.24,4.19 78.87,4.19 U2.44
  Bottom Layer w0.254: v1(77.75,67.44) 77.75,65.41 v1(76.48,64.14)
PE3: length 93.7
  Top Layer w0.254: v1(74.49,66.17) 74.74,65.91 74.74,5.78 U2.43 ; v1(76.01,67.69) 76.52,68.2 76.52,82.93 75.25,84.2 75.25,89.79 72.2,92.84
  Bottom Layer w0.254: v1(76.01,67.69) v1(74.49,66.17)
PE4: length 106
  Top Layer w0.254: v1(72.75,85.47) 72.75,89.79 69.7,92.84 ; v1(70.47,80.14) 70.47,77.09 67.92,74.55 67.92,65.66 74.28,59.31 74.28,4.7 77.07,1.91 80.52,1.91 81.28,2.67 81.28,4.32 U2.42
  Bottom Layer w0.254: v1(72.75,85.47) 72.75,82.42 v1(70.47,80.14)
PE5: length 107.3
  Top Layer w0.254: v1(74.82,79.38) 74.57,79.38 v1(73.3,78.11) ; v1(73.55,9.53) 73.81,9.78 73.81,59.06 67.46,65.41 67.46,75.06 v1(69.74,77.34)
  Bottom Layer w0.254: U2.41 73.55,9.5 v1(73.55,9.53) ; v1(73.3,78.11) 70.5,78.11 v1(69.74,77.34) ; v1(74.82,79.38) 80.16,84.71 80.16,85.47 78.89,86.74 73.3,86.74 67.2,92.84
PE6: length 136.6
  Top Layer w0.254: 64.7,92.84 63.43,91.57 61.66,91.57 60.89,92.33 60.89,93.35 62.67,95.12 80.45,95.12 81.72,93.85 v1(81.72,78.11) ; v1(78.93,79.38) 79.18,79.12 79.18,77.6 v1(78.93,77.34) ; v1(75.88,79.38) 75.88,74.04 v1(73.34,71.5) ; v1(73.09,13.84) 73.34,14.1 73.34,56.77 69.02,61.09 v1(68.26,61.09)
  Bottom Layer w0.254: v1(78.93,77.34) 79.69,78.11 v1(81.72,78.11) ; v1(73.09,13.84) 73.09,10.92 77.15,6.86 78.74,6.86 U2.40 ; v1(73.34,71.5) 71.56,71.5 68,67.95 68,61.34 v1(68.26,61.09) ; v1(78.93,79.38) v1(75.88,79.38)
PE7: length 91.3
  Top Layer w0.254: v1(79.47,64.13) 81.51,66.17 v1(81.51,66.42) ; v1(81,74.55) 81,93.85 80.24,94.61 63.98,94.61 循迹.8
  Bottom Layer w0.254: v1(79.47,64.13) 71.85,56.51 71.85,56.26 73.38,54.74 73.38,35.84 76.94,32.28 78.71,32.28 U2.22 ; v1(81.51,66.42) 81.51,74.04 v1(81,74.55)
PE8: length 27.2
  Top Layer w0.254: U2.21 78.74,29.72 78.74,27.94 79.5,27.18 80.52,27.18 84.84,22.86 84.84,22.35 85.85,21.34 86.61,21.34 87.88,20.07 87.88,11.68 86.11,9.91
PE9: length 31.7
  Top Layer w0.254: H3.2 88.39,9.65 88.39,21.84 80.52,29.72 v1(80.26,29.72)
  Bottom Layer w0.254: U2.20 81.28,32.26 81.28,30.48 80.52,29.72 v1(80.26,29.72)
PE10: length 37.9
  Top Layer w0.254: U2.19 75.69,31.75 75.69,8.13 76.96,6.86 84.07,6.86 86.11,4.83
PE11: length 11.3
  Top Layer w0.254: v1(82.8,33.53) 82.8,30.61 H4.8
  Bottom Layer w0.254: U2.18 80.26,36.07 v1(82.8,33.53)
PE12: length 11
  Top Layer w0.254: v1(83.44,32.51) H4.7
  Bottom Layer w0.254: U2.17 78.74,34.8 80.52,34.8 82.8,32.51 v1(83.44,32.51)
PE15: length 7.4
  Top Layer w0.254: v1(83.82,37.59) H4.4
  Bottom Layer w0.254: v1(83.82,37.59) 80.26,41.15 U2.14
POWER: length 16.9
  Bottom Layer w1: U19.1 17.53,68.45 11.47,74.51 SW1.3
R/A/H: length 31.9
  Top Layer w0.254: H10.3 56.16,70.38 56.16,73.31 59.06,76.2 v1(59.06,79.5) ; v1(54.99,87.12) 53.21,87.12 CN4.7
  Bottom Layer w0.254: v1(59.06,79.5) 56.77,81.79 56.77,86.61 56.26,87.12 v1(54.99,87.12)
T/B/L: length 29.7
  Top Layer w0.254: v1(56.77,72.9) 56.77,68.45 H10.4
  Bottom Layer w0.254: v1(56.77,72.9) 56.26,73.41 56.26,75.18 55.75,75.69 55.75,78.99 50.04,84.71 CN4.8
VREF+: length 28.1
  Top Layer w0.254: H5.7 94.49,31.24 94.49,35.31 93.47,36.32 92.96,36.32 91.95,37.34 91.95,41.15 86.61,46.48 v1(83.06,46.48)
  Bottom Layer w0.254: U2.8 82.3,46.48 v1(83.06,46.48)
$1N1923: length 5.7
  Bottom Layer w0.254: R2.1 17.67,95.63 LED1.2

## Copper pours and planes (outline as drawn; the poured copper is in the pictures)
12V on Top Layer: 17.02,85.85 17.02,80.77 12.83,76.58 12.83,75.33 13.09,75.06 19.94,75.06 20.07,75.18 20.07,90.03 19.63,90.47 19.63,88.46
12V on Top Layer: 32.07,87.96 34.49,87.96 34.54,88.01 34.54,85.24 32.07,85.24
12V on Top Layer: 16.89,90.55 16.89,85.09 17.02,84.96 35.31,84.96 33.27,86.99 33.27,94.49 33.4,94.61 30.1,94.61 28.96,93.47 28.96,90.68 28.83,90.55
POWER on Top Layer: 10.16,76.96 12.57,76.96 12.57,75.18 12.45,75.06 10.41,75.06 10.16,75.31
POWER on Top Layer: 23.24,69.98 25.53,69.98 25.53,67.18 23.24,67.18
POWER on Top Layer: 11.81,75.56 9.9,75.56 16.76,66.93 24.89,67.56 24.89,69.53 24.13,69.98 18.1,69.98

## Text on the board
Top Silkscreen Layer: MODE3 | GND | 3V3 | 5V | MODE1 | MODE4 | MODE5 | MODE2 | 12V | PD10 | PD11 | PD14 | PD15 | PB15 | PD13 | PD12 | PD9 | PD8 | PA8 | PD0 | PD1 | PD3 | PD4 | PD5 | PD6 | RX | TX | PB14 | PB13 | PB12 | PE15 | PC0 | PE12 | PE11 | PC4 | PC5 | PC1 | PA6 | PE8 | PE9 | PE10 | PC3 | PA7 | PC13 | PD7 | VDDA | VREF+ | PC2 | PB10 | PB11 | PB3 | VOUT+ | VIN+
